# Altium schematic sheet main sch.SchDoc
size A4; SheetNumber: 1; SheetTotal: 4
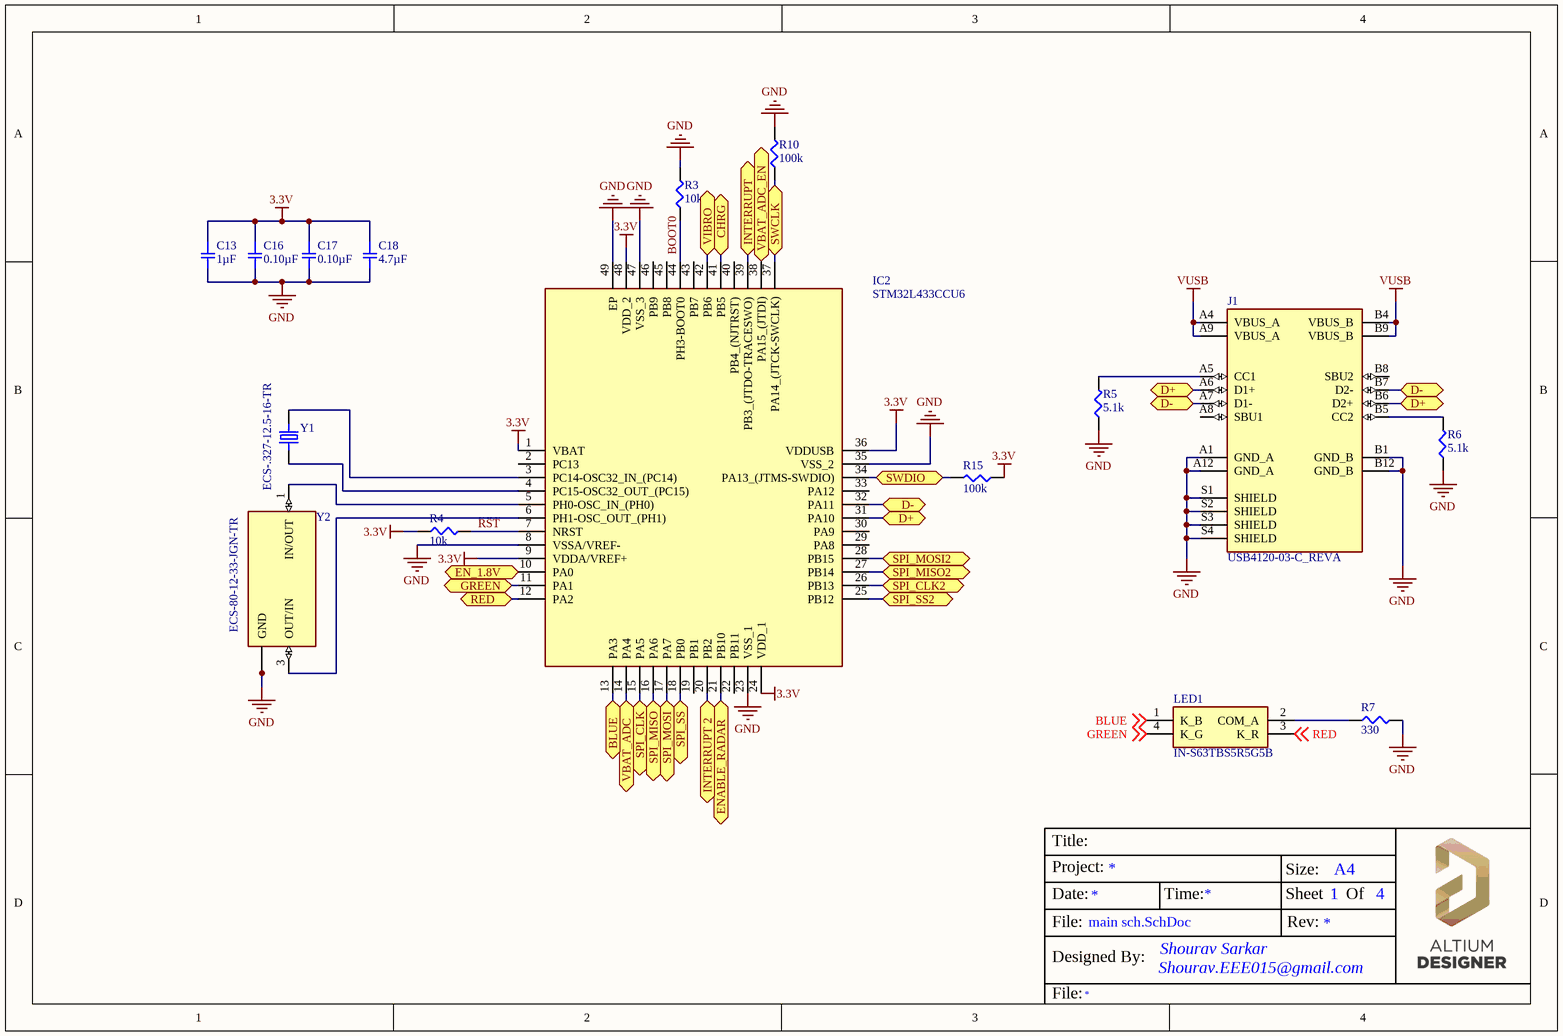
[diagram p0: main sch.SchDoc]

## Parts
C13  1µF  [SMD-0402C]
C16  0.10µF  [SMD-0402C]
C17  0.10µF  [SMD-0402C]
C18  4.7µF  [SMD-0402C]
IC2  STM32L433CCU6  [QFN50P700X700X60-49N-D]
J1  USB4120-03-C_REVA  [GCT_USB4120-03-C_REVA]
LED1  IN-S63TBS5R5G5B  [INS63TBS5R5G5B]
R3  10k  [SMD-0402-RES]
R4  10k  [SMD-0402-RES]
R5  5.1k  [SMD-0402-RES]
R6  5.1k  [SMD-0402-RES]
R7  330  [SMD-0402-RES]
R10  100k  [SMD-0402-RES]
R15  100k  [SMD-0402-RES]
Y1  ECS-.327-12.5-16-TR  [XTAL_ECS-.327-12.5-16-TR]
Y2  ECS-80-12-33-JGN-TR  [XTAL_ECS-240-8-33-AGN-TR]

## Ports
BLUE (bidir), CHRG (bidir), D+ (bidir), D- (bidir), EN_1.8V (bidir), ENABLE_RADAR (bidir), GREEN (bidir), INTERRUPT 2 (bidir), INTERRUPT (bidir), RED (bidir), SPI_CLK2 (bidir), SPI_CLK (bidir), SPI_MISO2 (bidir), SPI_MISO (bidir), SPI_MOSI2 (bidir), SPI_MOSI (bidir), SPI_SS2 (bidir), SPI_SS (bidir), SWCLK (bidir), SWDIO (bidir), VBAT_ADC (bidir), VBAT_ADC_EN (bidir), VIBRO (bidir)

## Nets
3.3V: C13.1 C16.1 C17.1 C18.1 IC2.1(VBAT) IC2.9(VDDA/VREF+) IC2.24(VDD_1) IC2.36(VDDUSB) IC2.48(VDD_2) R4.1 R15.1
GND: C13.2 C16.2 C17.2 C18.2 IC2.8(VSSA/VREF-) IC2.23(VSS_1) IC2.35(VSS_2) IC2.47(VSS_3) IC2.49(EP) J1.A1(GND_A) J1.A12(GND_A) J1.B1(GND_B) J1.B12(GND_B) J1.S1(SHIELD) J1.S2(SHIELD) J1.S3(SHIELD) J1.S4(SHIELD) R3.2 R5.1 R6.1 R7.2 R10.2 Y2.2(GND) Y2.4(GND)
VUSB: J1.A4(VBUS_A) J1.A9(VBUS_A) J1.B4(VBUS_B) J1.B9(VBUS_B)
BLUE: IC2.13(PA3) ; port BLUE
BLUE: LED1.1(K_B) ; off-sheet BLUE  [a separate net that carries the same name]
BOOT0: IC2.44(PH3-BOOT0) R3.1
CHRG: IC2.41(PB5) ; port CHRG
D+: IC2.31(PA10) J1.A6(D1+) J1.B6(D2+) ; port D+
D-: IC2.32(PA11) J1.A7(D1-) J1.B7(D2-) ; port D-
EN_1.8V: IC2.10(PA0) ; port EN_1.8V
ENABLE_RADAR: IC2.21(PB10) ; port ENABLE_RADAR
GREEN: IC2.11(PA1) ; port GREEN
GREEN: LED1.4(K_G) ; off-sheet GREEN  [a separate net that carries the same name]
INTERRUPT: IC2.39(PB3_(JTDO-TRACESWO)) ; port INTERRUPT
INTERRUPT 2: IC2.20(PB2) ; port INTERRUPT 2
RED: IC2.12(PA2) ; port RED
RED: LED1.3(K_R) ; off-sheet RED  [a separate net that carries the same name]
RST: IC2.7(NRST) R4.2
SPI_CLK: IC2.15(PA5) ; port SPI_CLK
SPI_CLK2: IC2.26(PB13) ; port SPI_CLK2
SPI_MISO: IC2.16(PA6) ; port SPI_MISO
SPI_MISO2: IC2.27(PB14) ; port SPI_MISO2
SPI_MOSI: IC2.17(PA7) ; port SPI_MOSI
SPI_MOSI2: IC2.28(PB15) ; port SPI_MOSI2
SPI_SS: IC2.18(PB0) ; port SPI_SS
SPI_SS2: IC2.25(PB12) ; port SPI_SS2
SWCLK: IC2.37(PA14_(JTCK-SWCLK)) R10.1 ; port SWCLK
SWDIO: IC2.34(PA13_(JTMS-SWDIO)) R15.2 ; port SWDIO
VBAT_ADC: IC2.14(PA4) ; port VBAT_ADC
VIBRO: IC2.42(PB6) ; port VIBRO
NetIC2_3: IC2.3(PC14-OSC32_IN_(PC14)) Y1.1
NetIC2_4: IC2.4(PC15-OSC32_OUT_(PC15)) Y1.2
NetIC2_5: IC2.5(PH0-OSC_IN_(PH0)) Y2.1(IN/OUT)
NetIC2_6: IC2.6(PH1-OSC_OUT_(PH1)) Y2.3(OUT/IN)
NetJ1_A5: J1.A5(CC1) R5.2
NetJ1_B5: J1.B5(CC2) R6.2
NetLED1_2: LED1.2(COM_A) R7.1

Not connected (* = marked no-connect by the designer): IC2 2(PC13) 19(PB1) 22(PB11) 29(PA8) 30(PA9) 33(PA12) 38(PA15_(JTDI)) 40(PB4_(NJTRST)) 43(PB7) 45(PB8) 46(PB9); J1 A8(SBU1) B8(SBU2)

## Notes on the sheet
- Title:
- Project:
- Date:
- Time:
- Sheet
- Size:
- A4
- Of
- Designed By:
- File:
- Shourav.EEE015@gmail.com
- Shourav Sarkar
- Rev:

## Library data of the parts
C13 = GCM155C71A105KE38D: CAP CER 1UF 10V X7S 0402; Manufacturer: Murata Electronics North America; Factory Stock: 0; Unit Price (USD): 0.12; Minimum Quantity: 1; Tolerance: ±10%; Datasheets: http://www.murata.com/~/media/webrenewal/support/library/catalog/products/capacitor/mlcc/c03e.ashx; Image: //media.digikey.com/Renders/Murata%20Renders/ZRB-SERIES-0402.jpg; Digi-Key Part Number: 490-13409-1-ND; Part Number: GCM155C71A105KE38D; Quantity Available: 7240; @ qty: 0; Packaging: Cut Tape (CT); Series: GCM; Part Status: Active; Value: 1µF; Voltage: 10V; Temperature Coefficient: X7S; Operating Temperature: -55°C ~ 125°C; Features: -; Ratings: AEC-Q200; Applications: Automotive; Mounting Type: Surface Mount, MLCC; Package / Case: 0402 (1005 Metric); Size / Dimension: 0.039" L x 0.020" W (1.00mm x 0.50mm); Height - Seated (Max): -; Thickness (Max): 0.022" (0.55mm); Lead Spacing: -; Lead Style: -
C16 C17 = GCM155R71C104KA55D: CAP CER 0.1UF 16V X7R 0402; Manufacturer: Murata Electronics North America; Factory Stock: 0; Unit Price (USD): 0.1; Minimum Quantity: 1; Tolerance: ±10%; Datasheets: http://www.murata.com/~/media/webrenewal/support/library/catalog/products/capacitor/mlcc/c03e.ashx; Image: //media.digikey.com/Renders/Murata%20Renders/ZRB-SERIES-0402.jpg; Digi-Key Part Number: 490-4759-1-ND; Part Number: GCM155R71C104KA55D; Quantity Available: 734194; @ qty: 0; Packaging: Cut Tape (CT); Series: GCM; Part Status: Active; Value: 0.10µF; Voltage: 16V; Temperature Coefficient: X7R; Operating Temperature: -55°C ~ 125°C; Features: -; Ratings: AEC-Q200; Applications: Automotive; Mounting Type: Surface Mount, MLCC; Package / Case: 0402 (1005 Metric); Size / Dimension: 0.039" L x 0.020" W (1.00mm x 0.50mm); Height - Seated (Max): -; Thickness (Max): 0.022" (0.55mm); Lead Spacing: -; Lead Style: -
C18 = GRM153R60J475ME15D: CAP CER 4.7UF 6.3V X5R 0402; Manufacturer: Murata Electronics North America; Factory Stock: 0; Unit Price (USD): 0.27; Minimum Quantity: 1; Tolerance: ±20%; Datasheets: http://psearch.en.murata.com/capacitor/product/GRM153R60J475ME15%23.pdf; Image: //media.digikey.com/Renders/Murata%20Renders/ZRB-SERIES-0402.jpg; Digi-Key Part Number: 490-13232-1-ND; Part Number: GRM153R60J475ME15D; Quantity Available: 30412; @ qty: 0; Packaging: Cut Tape (CT); Series: GRM; Part Status: Active; Value: 4.7µF; Voltage: 6.3V; Temperature Coefficient: X5R; Operating Temperature: -55°C ~ 85°C; Features: Derating Recommended; Ratings: -; Applications: General Purpose; Mounting Type: Surface Mount, MLCC; Package / Case: 0402 (1005 Metric); Size / Dimension: 0.039" L x 0.020" W (1.00mm x 0.50mm); Height - Seated (Max): -; Thickness (Max): 0.013" (0.33mm); Lead Spacing: -; Lead Style: -
IC2 = STM32L433CCU6: Integrated Circuit; Manufacturer_Name: STMicroelectronics; Datasheet Link: http://www.st.com/content/ccc/resource/technical/document/datasheet/f7/a0/fc/27/24/4e/4f/3f/DM00257192.pdf/files/DM00257192.pdf/jcr:content/translations/en.DM00257192.pdf; Height: 0.6mm; Manufacturer_Part_Number: STM32L433CCU6; Mouser Part Number: 511-STM32L433CCU6; Mouser Price/Stock: https://www.mouser.co.uk/ProductDetail/STMicroelectronics/STM32L433CCU6?qs=dTJS0cRn7oiKq9T6SJeUpg%3D%3D; Arrow Part Number: STM32L433CCU6; Arrow Price/Stock: https://www.arrow.com/en/products/stm32l433ccu6/stmicroelectronics?region=nac
J1 = USB4120-03-C_REVA: MF: {'manufacturer': u'Global Connector Technology'}; Package: None; Price: None; Value: *; MP: USB4120-03-C_REVA; Availability: Unavailable
LED1 = IN-S63TBS5R5G5B: LED; Manufacturer_Name: Inolux; Datasheet Link: http://www.inolux-corp.com/datasheet/SMDLED/RGB%20Side%20View/IN-S63TBS5R5G5B_V1.0.pdf; Height: 0.6mm; Manufacturer_Part_Number: IN-S63TBS5R5G5B; Mouser Part Number: 743-IN-S63TBS5R5G5B; Mouser Price/Stock: https://www.mouser.co.uk/ProductDetail/Inolux/IN-S63TBS5R5G5B?qs=stqOd1AaK7%2Fi2QYkhDu%252BwA%3D%3D; Arrow Part Number: IN-S63TBS5R5G5B; Arrow Price/Stock: https://www.arrow.com/en/products/in-s63tbs5r5g5b/inolux-corporation?region=nac
R3 R4 = ERJ-2GEJ103X: RES SMD 10K OHM 5% 1/10W 0402; Manufacturer: Panasonic Electronic Components; Factory Stock: 0; Unit Price (USD): 0.00350; @ qty: 1500; Minimum Quantity: 1; Power (Watts): 0.1W, 1/10W; Temperature Coefficient: ±200ppm/°C; Part Number: ERJ-2GEJ103X; Datasheets: http://industrial.panasonic.com/www-cgi/jvcr13pz.cgi?E+PZ+3+AOA0001+ERJ2GEJ103X+7+WW; Image: //media.digikey.com/Photos/Panasonic%20Photos/ERJ-PA2-Series.jpg; Digi-Key Part Number: P10KJCT-ND; Quantity Available: 2560215; Packaging: Cut Tape (CT); Series: ERJ; Part Status: Active; Value: 10k; Tolerance: ±5%; Composition: Thick Film; Features: Automotive AEC-Q200; Operating Temperature: -55°C ~ 155°C; Package / Case: 0402 (1005 Metric); Supplier Device Package: 0402; Size / Dimension: 0.039" L x 0.020" W (1.00mm x 0.50mm); Height - Seated (Max): 0.016" (0.40mm); Number of Terminations: 2; Failure Rate: -
R5 R6 = ERJ-2GEJ512X: RES SMD 5.1K OHM 5% 1/10W 0402; Manufacturer: Panasonic Electronic Components; Factory Stock: 0; Unit Price (USD): 0.00350; @ qty: 1500; Minimum Quantity: 1; Power (Watts): 0.1W, 1/10W; Temperature Coefficient: ±200ppm/°C; Part Number: ERJ-2GEJ512X; Datasheets: http://industrial.panasonic.com/www-cgi/jvcr13pz.cgi?E+PZ+3+AOA0001+ERJ2GEJ512X+7+WW; Image: //media.digikey.com/Photos/Panasonic%20Photos/ERJ-PA2-Series.jpg; Digi-Key Part Number: P5.1KJCT-ND; Quantity Available: 153265; Packaging: Cut Tape (CT); Series: ERJ; Part Status: Active; Value: 5.1k; Tolerance: ±5%; Composition: Thick Film; Features: Automotive AEC-Q200; Operating Temperature: -55°C ~ 155°C; Package / Case: 0402 (1005 Metric); Supplier Device Package: 0402; Size / Dimension: 0.039" L x 0.020" W (1.00mm x 0.50mm); Height - Seated (Max): 0.016" (0.40mm); Number of Terminations: 2; Failure Rate: -
R7 = ERJ-2RKF3300X: RES SMD 330 OHM 1% 1/10W 0402; Manufacturer: Panasonic Electronic Components; Factory Stock: 0; Unit Price (USD): 0.00496; @ qty: 1500; Minimum Quantity: 1; Power (Watts): 0.1W, 1/10W; Temperature Coefficient: ±100ppm/°C; Part Number: ERJ-2RKF3300X; Datasheets: http://industrial.panasonic.com/www-cgi/jvcr13pz.cgi?E+PZ+3+AOA0002+ERJ2RKF3300X+7+WW; Image: //media.digikey.com/Photos/Panasonic%20Photos/ERJ-PA2-Series.jpg; Digi-Key Part Number: P330LCT-ND; Quantity Available: 537077; Packaging: Cut Tape (CT); Series: ERJ; Part Status: Active; Value: 330; Tolerance: ±1%; Composition: Thick Film; Features: Automotive AEC-Q200; Operating Temperature: -55°C ~ 155°C; Package / Case: 0402 (1005 Metric); Supplier Device Package: 0402; Size / Dimension: 0.039" L x 0.020" W (1.00mm x 0.50mm); Height - Seated (Max): 0.016" (0.40mm); Number of Terminations: 2; Failure Rate: -
R10 R15 = ERJ-2GEJ104X: RES SMD 100K OHM 5% 1/10W 0402; Manufacturer: Panasonic Electronic Components; Factory Stock: 0; Unit Price (USD): 0.00350; @ qty: 1500; Minimum Quantity: 1; Power (Watts): 0.1W, 1/10W; Temperature Coefficient: ±200ppm/°C; Part Number: ERJ-2GEJ104X; Datasheets: http://industrial.panasonic.com/www-cgi/jvcr13pz.cgi?E+PZ+3+AOA0001+ERJ2GEJ104X+7+WW; Image: //media.digikey.com/Photos/Panasonic%20Photos/ERJ-PA2-Series.jpg; Digi-Key Part Number: P100KJCT-ND; Quantity Available: 2387986; Packaging: Cut Tape (CT); Series: ERJ; Part Status: Active; Value: 100k; Tolerance: ±5%; Composition: Thick Film; Features: Automotive AEC-Q200; Operating Temperature: -55°C ~ 155°C; Package / Case: 0402 (1005 Metric); Supplier Device Package: 0402; Size / Dimension: 0.039" L x 0.020" W (1.00mm x 0.50mm); Height - Seated (Max): 0.016" (0.40mm); Number of Terminations: 2; Failure Rate: -
Y1 = ECS-.327-12.5-16-TR: SMD Tuning Fork Crystal; MF: {'manufacturer': u'ECS Inc.'}; Package: None; Price: None; Value: *; MP: ECS-.327-12.5-16-TR; Availability: Unavailable
Y2 = ECS-80-12-33-JGN-TR: The sub miniature ECX-32 is a compact SMD Crystal. The 3.2 x 2.5 x 0.8 mm ceramic package is ideal for todayâ€™s SMD manufacturing environment.; MF: {'manufacturer': u'ECS Inc.'}; Package: None; Price: None; Value: *; MP: ECS-80-12-33-JGN-TR; Availability: Unavailable